# Altium schematic sheet Connector_Section.SchDoc: =Projectname
size A4; SheetNumber: 3; SheetTotal: 4
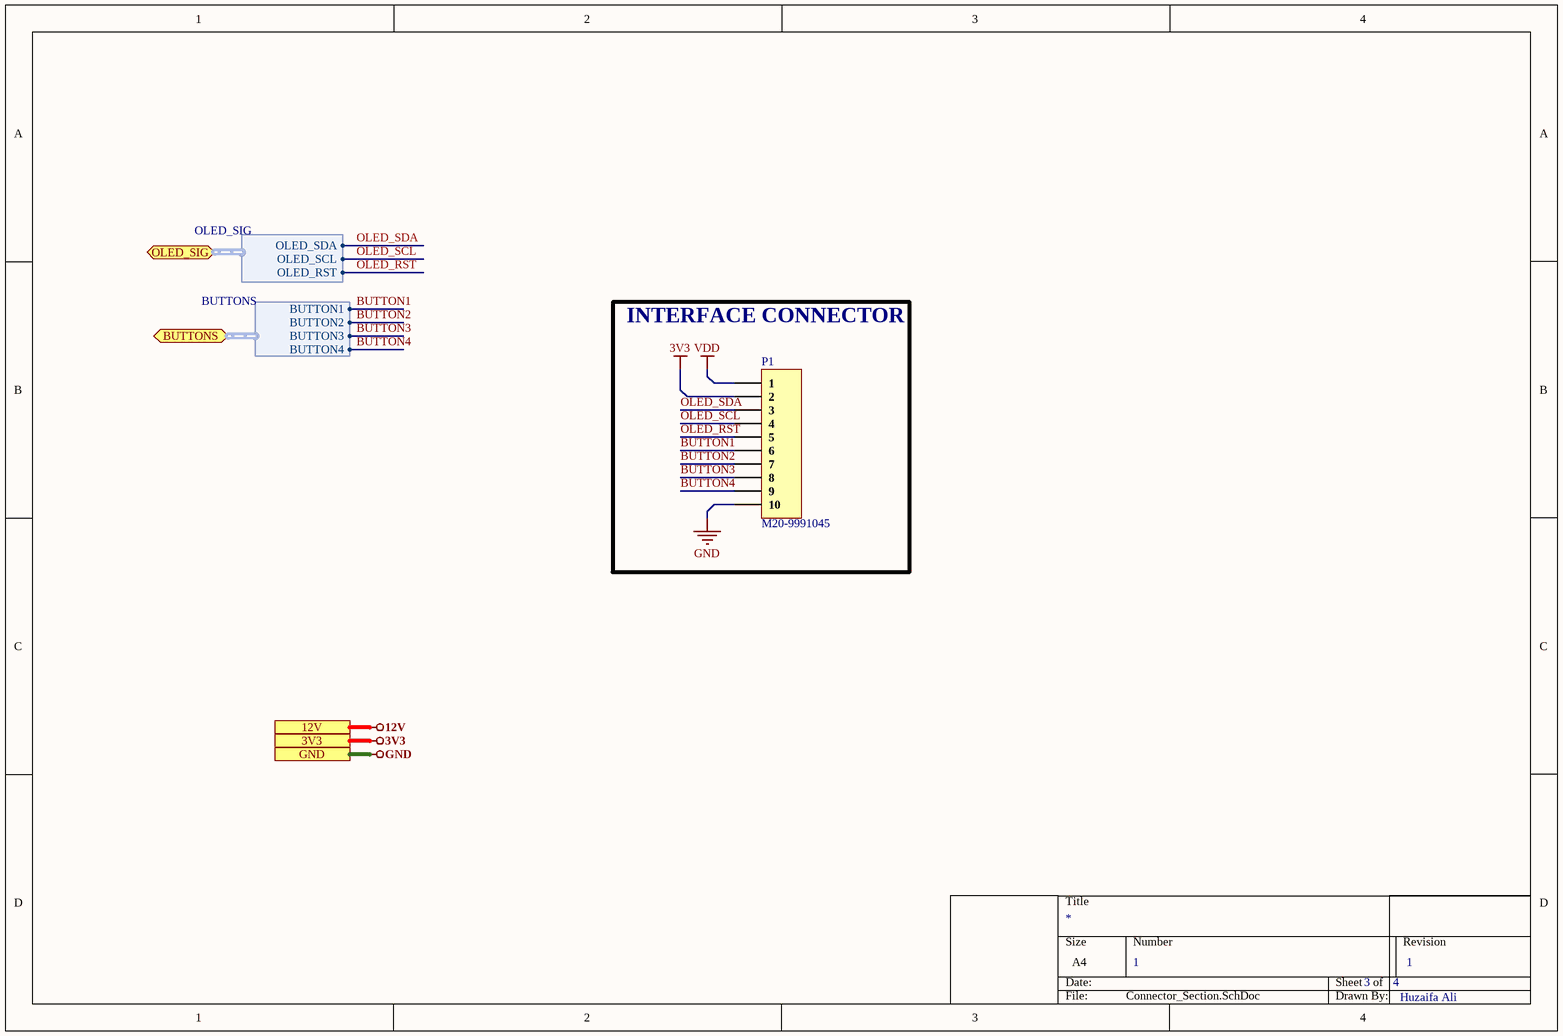
[diagram p0: Connector_Section.SchDoc]

## Parts
P1  M20-9991045  [HDR1X10]

## Blocks framed on the sheet
INTERFACE CONNECTOR: P1

## Ports
3V3, 12V, BUTTONS (bidir, harness BUTTONS), GND, OLED_SIG (bidir, harness OLED_SIG)

## Harnesses
OLED_SIG: OLED_SDA, OLED_SCL, OLED_RST
BUTTONS: BUTTON1, BUTTON2, BUTTON3, BUTTON4

## Nets
3V3: P1.2 ; port 3V3
12V: port 12V
GND: P1.10 ; port GND
VDD: P1.1
BUTTON1: P1.6 ; port BUTTONS.BUTTON1
BUTTON2: P1.7 ; port BUTTONS.BUTTON2
BUTTON3: P1.8 ; port BUTTONS.BUTTON3
BUTTON4: P1.9 ; port BUTTONS.BUTTON4
OLED_RST: P1.5 ; port OLED_SIG.OLED_RST
OLED_SCL: P1.4 ; port OLED_SIG.OLED_SCL
OLED_SDA: P1.3 ; port OLED_SIG.OLED_SDA

## Notes on the sheet
- 1
- Huzaifa Ali

## Library data of the parts
P1 = M20-9991045: CONN HEADER VERT 10POS 2.54MM; Manufacturer: Harwin; Number of Contacts: 10; Max Current Rating: 3A; Contact Resistance: 25mR; Gender: Male; Insulation Resistance: 10GR; Connector Type: Male Pin; Supplier 1: Digi-Key; Manufacturer Part Number: M20-9991045; Stock 1: 1623; Pricing 1: 1=0.44, 10=0.413, 100=0.2891, 500=0.2478, 1000=0.2065, 5000=0.177, 10000=0.1652 (USD); Mount: Through Hole; Case/Package: SIL; Weight: 0.020459oz; Color: Black; Contact Plating: Gold; Contact Material: Brass,Bronze; Housing Color: Black; Housing Material: Nylon; Min Operating Temperature: -40°C; Max Operating Temperature: 105°C; Number of Rows: 1; Termination: Solder; Packaging: Bulk; Current Rating: 3A; Package Quantity: 500; Number of Positions: 10; Orientation: Straight; Length: 25.4mm; Height: 0.125inch; Width: 0.5inch; Pitch: 2.54mm; Contact Mating Length: 0.24inch; Depth: 2.54mm; Radiation Hardening: No; REACH SVHC: No SVHC; ComponentLink1URL: http://www.mouser.com/ds/2/181/Harwin_Product_Catalog_page_206-1134556.pdf?src-supplier=Mouser; ComponentLink1Description: http://www.mouser.com/ds/2/181/Harwin_Product_Catalog_page_206-1134556.pdf?src-supplier=Mouser; ComponentLink2URL: http://www.farnell.com/cad/689114.pdf?src-supplier=Element14; ComponentLink2Description: http://www.farnell.com/cad/689114.pdf?src-supplier=Element14; Supplier Part Number 1: 952-1842-ND